# Altium schematic sheet ADC_Section.SchDoc
size A; DocumentNumber: 5; SheetNumber: 6; SheetTotal: 6
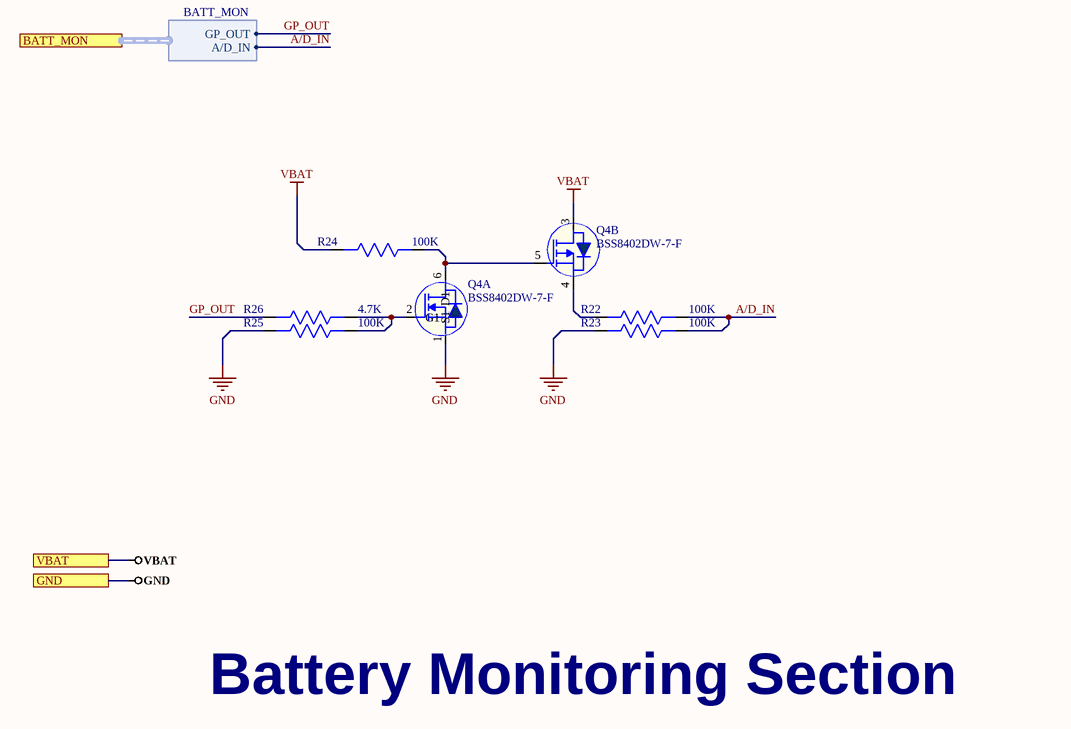
[diagram p0: ADC_Section.SchDoc]

## Parts
Q4  BSS8402DW-7-F  [SOT-363]  (parts A,B of 2)
R22  100K  [RES-0603]
R23  100K  [RES-0603]
R24  100K  [RES-0603]
R25  100K  [RES-0603]
R26  4.7K  [RES-0603]

## Ports
BATT_MON (harness BATT_MON), GND, VBAT

## Harnesses
BATT_MON: GP_OUT, A/D_IN

## Nets
GND: Q4.1(S1) R23.2 R25.2 ; port GND
VBAT: Q4.3(D2) R24.1 ; port VBAT
A/D_IN: R22.1 R23.1 ; port BATT_MON.A/D_IN
GP_OUT: R26.2 ; port BATT_MON.GP_OUT
NetQ4_2: Q4.2(G1) R25.1 R26.1
NetQ4_4: Q4.4(S2) R22.2
NetQ4_5: Q4.5(G2) Q4.6(D1) R24.2

## Notes on the sheet
- Battery Monitoring Section

## Library data of the parts
Q4 = BSS8402DW-7-F: MOSFET N/P-CH 60V/50V SC70-6; Manufacturer: Diodes; Gate to Source Voltage (Vgs): 20V; Nominal Vgs: 2.5V; Rds On Max: 7.5R; Input Capacitance: 50pF; Max Power Dissipation: 200mW; Number of Elements: 2; Dual Supply Voltage: 60V; Continuous Drain Current (ID): 115mA; Drain to Source Resistance: 4.4R; Turn-Off Delay Time: 18ns; Drain to Source Voltage (Vdss): -50V; Element Configuration: Dual; Turn-On Delay Time: 10ns; On-State Resistance: 10R; FET Type: N and P-Channel; Polarity: N-CHANNEL,P-CHANNEL; Supplier 1: Digi-Key; Manufacturer Part Number: BSS8402DW-7-F; RoHS: Yes; Category: MOSFETs; Stock 1: 180980; Pricing 1: 1=0.55000, 10=0.44500, 100=0.30310, 500=0.22730, 1000=0.17048 (USD); Mount: Surface Mount; Case/Package: SOT-363; Number of Pins: 6; Weight: 0.000212oz; Contact Plating: Tin,Matte; Min Operating Temperature: -55°C; Max Operating Temperature: 150°C; Package Quantity: 3000; Packaging: Tape and Reel; Power Dissipation: 200mW; Threshold Voltage: 2.5V; Termination: SMD/SMT; Number of Channels: 2; Current Rating: 115mA; Series: -; Drain-source On Resistance-Max: 10R; Length: 2.2mm; Width: 1.35mm; Height: 1mm; REACH SVHC: No SVHC; Lead Free: Lead Free; RoHS Compliant: Yes; ComponentLink1URL: https://datasheet.ciiva.com/1252/ds30380-1252496.pdf?src-supplier=Newark; ComponentLink1Description: https://datasheet.ciiva.com/1252/ds30380-1252496.pdf?src-supplier=Newark; ComponentLink2URL: https://datasheet.ciiva.com/4442/ds30380-80943-4442992.pdf?src-supplier=Mouser; ComponentLink2Description: https://datasheet.ciiva.com/4442/ds30380-80943-4442992.pdf?src-supplier=Mouser; ComponentLink3URL: https://datasheet.ciiva.com/34302/1539454-34302372.pdf?src-supplier=Jameco; ComponentLink3Description: https://datasheet.ciiva.com/34302/1539454-34302372.pdf?src-supplier=Jameco; ComponentLink4URL: https://datasheet.ciiva.com/26789/bss8402dw-7-f-26789052.pdf?src-supplier=IIIC; ComponentLink4Description: https://datasheet.ciiva.com/26789/bss8402dw-7-f-26789052.pdf?src-supplier=IIIC; ComponentLink5URL: https://datasheet.ciiva.com/17323/ds30380-17323221.pdf?src-supplier=Avnet+Europe; ComponentLink5Description: https://datasheet.ciiva.com/17323/ds30380-17323221.pdf?src-supplier=Avnet+Europe; ComponentLink6URL: https://datasheet.ciiva.com/928/ds30380-928742.pdf?src-supplier=Digi-Key; ComponentLink6Description: https://datasheet.ciiva.com/928/ds30380-928742.pdf?src-supplier=Digi-Key; ComponentLink7URL: https://datasheet.ciiva.com/928/ds30380-928743.pdf?src-supplier=Digi-Key; ComponentLink7Description: https://datasheet.ciiva.com/928/ds30380-928743.pdf?src-supplier=Digi-Key; ComponentLink8URL: https://datasheet.ciiva.com/928/ds30380-928744.pdf?src-supplier=Digi-Key; ComponentLink8Description: https://datasheet.ciiva.com/928/ds30380-928744.pdf?src-supplier=Digi-Key; ComponentLink9URL: https://datasheet.ciiva.com/16419/ds30380-16419384.pdf?src-supplier=Future+Electronics; ComponentLink9Description: https://datasheet.ciiva.com/16419/ds30380-16419384.pdf?src-supplier=Future+Electronics; ComponentLink10URL: https://datasheet.ciiva.com/1190/ds30380-1190250.pdf?src-supplier=Element14; ComponentLink10Description: https://datasheet.ciiva.com/1190/ds30380-1190250.pdf?src-supplier=Element14; Supplier Part Number 1: BSS8402DW-FDICT-ND
R22-R25 = RC0603JR-07100KL: Res Thick Film 0603 100K Ohm 5% 1/10W 100ppm/C Molded SMD SMD Paper T/R; Manufacturer: Yageo; Resistance: 100kR; Temperature Coefficient: 100ppm/°C; Voltage Rating: 50V; Power Rating: 100mW; Supplier 1: Digi-Key; Manufacturer Part Number: RC0603JR-07100KL; RoHS: Yes; Category: Chip SMD Resistors; Stock 1: 1210037; Pricing 1: 1=0.10000, 10=0.02000, 100=0.00800, 1000=0.00360, 2500=0.00312 (USD); Case/Package: 0603; Number of Pins: 2; Contact Plating: Tin,Matte; Case Code (Imperial): 0603; Case Code (Metric): 1608; Size Code: 0603; Min Operating Temperature: -55°C; Max Operating Temperature: 155°C; Tolerance: 5%; Resistor Type: Thick Film; Packaging: Tape and Reel; Voltage Rating (DC): 50V; Termination: SMD/SMT; Features: Moisture Resistant; Series: RC; Max Power Dissipation: 100mW; Number of Terminations: 2; Resistance Tolerance: 5%; Width: 0.8mm; Radiation Hardening: No; REACH SVHC: No SVHC; Lead Free: Lead Free; RoHS Compliant: Yes; ComponentLink1URL: https://datasheet.ciiva.com/7746/443971-7746424.pdf?src-supplier=Element14; ComponentLink1Description: https://datasheet.ciiva.com/7746/443971-7746424.pdf?src-supplier=Element14; ComponentLink2URL: https://datasheet.ciiva.com/7983/443971-7983686.pdf?src-supplier=Element14; ComponentLink2Description: https://datasheet.ciiva.com/7983/443971-7983686.pdf?src-supplier=Element14; ComponentLink3URL: https://datasheet.ciiva.com/7746/443971-7746423.pdf?src-supplier=Element14; ComponentLink3Description: https://datasheet.ciiva.com/7746/443971-7746423.pdf?src-supplier=Element14; ComponentLink4URL: https://datasheet.ciiva.com/8887/pyu-rc0603-51-rohs-l-4-8887903.pdf?src-supplier=Avnet; ComponentLink4Description: https://datasheet.ciiva.com/8887/pyu-rc0603-51-rohs-l-4-8887903.pdf?src-supplier=Avnet; Supplier Part Number 1: 311-100KGRCT-ND
R26 = RC0603FR-074K7L: RES SMD 4.7K OHM 1% 1/10W 0603; Manufacturer: Yageo; Resistance: 4.7kR; Temperature Coefficient: 100ppm/°C; Power Rating: 100mW; Voltage Rating (DC): 50V; Supplier 1: Digi-Key; Manufacturer Part Number: RC0603FR-074K7L; RoHS: Yes; Category: Chip SMD Resistors; Stock 1: 1924316; Pricing 1: 1=0.10000, 10=0.02400, 100=0.00970, 1000=0.00436, 2500=0.00378 (USD); Case/Package: 0603; Number of Pins: 2; Case Code (Imperial): 0603; Case Code (Metric): 1608; Size Code: 0603; Min Operating Temperature: -55°C; Max Operating Temperature: 155°C; Tolerance: 1%; Resistor Type: Thick Film; Packaging: Tape and Reel; Voltage Rating: 50V; Termination: SMD/SMT; Features: Moisture Resistant; Series: RC; Max Power Dissipation: 100mW; Number of Terminations: 2; Construction: Rectangular; Resistance Tolerance: 1%; Length: 1.6mm; Width: 0.8mm; Height: 0.45mm; Depth: 0.8mm; Lead Pitch: 0.3mm; REACH SVHC: No SVHC; Lead Free: Lead Free; RoHS Compliant: Yes; Military Standard: Not; ComponentLink1URL: https://datasheet.ciiva.com/15189/getdatasheetpartid-422754-15189760.pdf?src-supplier=Verical; ComponentLink1Description: https://datasheet.ciiva.com/15189/getdatasheetpartid-422754-15189760.pdf?src-supplier=Verical; ComponentLink2URL: https://datasheet.ciiva.com/22747/443971-22747528.pdf?src-supplier=Element14; ComponentLink2Description: https://datasheet.ciiva.com/22747/443971-22747528.pdf?src-supplier=Element14; ComponentLink3URL: https://datasheet.ciiva.com/7660/38590-7660794.pdf?src-supplier=Element14; ComponentLink3Description: https://datasheet.ciiva.com/7660/38590-7660794.pdf?src-supplier=Element14; ComponentLink4URL: https://datasheet.ciiva.com/7746/1868787-7746365.pdf?src-supplier=Element14; ComponentLink4Description: https://datasheet.ciiva.com/7746/1868787-7746365.pdf?src-supplier=Element14; ComponentLink5URL: https://datasheet.ciiva.com/46440/1868787-46440909.pdf?src-supplier=Element14; ComponentLink5Description: https://datasheet.ciiva.com/46440/1868787-46440909.pdf?src-supplier=Element14; ComponentLink6URL: https://datasheet.ciiva.com/7746/1738695-7746366.pdf?src-supplier=Element14; ComponentLink6Description: https://datasheet.ciiva.com/7746/1738695-7746366.pdf?src-supplier=Element14; Supplier Part Number 1: 311-4.70KHRCT-ND